# Altium schematic sheet HDMI2.0_SHEET.SchDoc
size A4; SheetNumber: 21; SheetTotal: 23
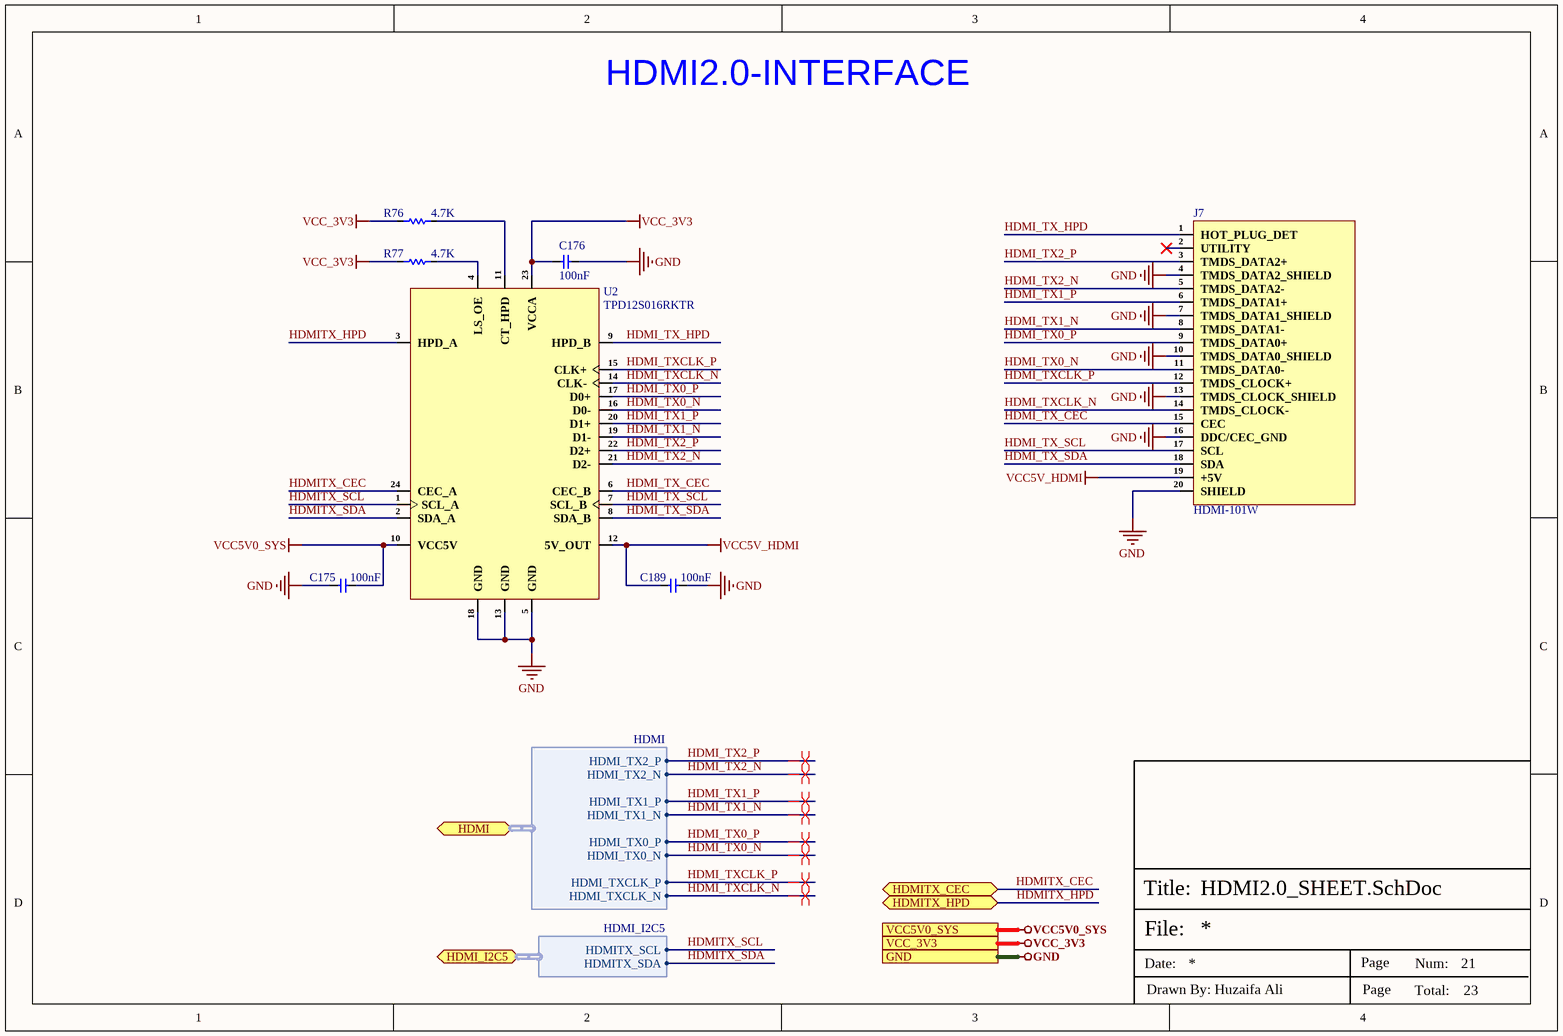
[diagram p0: HDMI2.0_SHEET.SchDoc]

## Parts
C175  100nF  [Cap-0402]
C176  100nF  [Cap-0402]
C189  100nF  [Cap-0402]
J7  HDMI-101W  [HDMI-101W]
R76  4.7K  [Res-0402]
R77  4.7K  [Res-0402]
U2  TPD12S016RKTR  [24-UQFN (4x2)]

## Ports
GND (see DRAM_LPDDR4_SHEET[6D], eMMC_SPI-FLASH_SHEET[1D], POWER_LDO_SHEET[3D], POWER_OTHER_SHEET[3C], POWER_PMIC_RK809_CODEC[3C], POWER_PMIC_RK809_DC DC[3D], POWER_PMIC_RK809_LDO[4C], POWER_PMIC_RK809_MGM[3D], RK3566_AUDIO_SHEET[3C], RK3566_DDR-PHY_SHEET[5D], RK3566_FLASH-SD_SHEET[4C], RK3566_OSC_PMUIO_SHEET[5D], RK3566_POWER_SHEET[3D], RK3566_SARADC_GPIO[3D], RK3566_USB_PCIe_SHEET[3D], RK3566_VI_SHEET[3D], RK3566_VO_SHEET_1[3C], RK3566_VO_SHEET_2[4C], TYPE-C_INTERFACE_SHEET[3D], TYPE-C_TO_MIPI-CSI_SHEET[5D], USB2.0_SHEET[3D], WIFI-6_SHEET[3D]), HDMI (bidir, harness HDMI, see RK3566_VO_SHEET_1[2C]), HDMI_I2C5 (bidir, harness HDMI_I2C5, see RK3566_AUDIO_SHEET[3B]), HDMITX_CEC (bidir, see RK3566_AUDIO_SHEET[3C]), HDMITX_HPD (bidir, see RK3566_VO_SHEET_1[3C]), VCC5V0_SYS (see POWER_LDO_SHEET[3D], POWER_OTHER_SHEET[3C], POWER_PMIC_RK809_CODEC[3C], POWER_PMIC_RK809_MGM[3D], RK3566_USB_PCIe_SHEET[3C], TYPE-C_INTERFACE_SHEET[3D], USB2.0_SHEET[3D]), VCC_3V3 (see eMMC_SPI-FLASH_SHEET[1D], POWER_PMIC_RK809_LDO[4C], RK3566_AUDIO_SHEET[3C], RK3566_SARADC_GPIO[3D], RK3566_USB_PCIe_SHEET[3D], RK3566_VI_SHEET[3D], RK3566_VO_SHEET_2[4C], TYPE-C_TO_MIPI-CSI_SHEET[5D], WIFI-6_SHEET[3D])

## Harnesses
HDMI_I2C5: HDMITX_SCL, HDMITX_SDA
HDMI: HDMI_TX2_P, HDMI_TX2_N, HDMI_TX1_P, HDMI_TX1_N, HDMI_TX0_P, HDMI_TX0_N, HDMI_TXCLK_P, HDMI_TXCLK_N

## Nets
GND: C175.2 C176.1 C189.2 J7.4(TMDS_DATA2_SHIELD) J7.7(TMDS_DATA1_SHIELD) J7.10(TMDS_DATA0_SHIELD) J7.13(TMDS_CLOCK_SHIELD) J7.16(DDC/CEC_GND) J7.20(SHIELD) U2.5(GND) U2.13(GND) U2.18(GND) ; port GND
VCC5V0_SYS: C175.1 U2.10(VCC5V) ; port VCC5V0_SYS
VCC5V_HDMI: C189.1 J7.19(+5V) U2.12(5V_OUT)
VCC_3V3: C176.2 R76.2 R77.2 U2.23(VCCA) ; port VCC_3V3
HDMI_TX0_N: J7.11(TMDS_DATA0-) U2.16(D0-) ; port HDMI.HDMI_TX0_N
HDMI_TX0_P: J7.9(TMDS_DATA0+) U2.17(D0+) ; port HDMI.HDMI_TX0_P
HDMI_TX1_N: J7.8(TMDS_DATA1-) U2.19(D1-) ; port HDMI.HDMI_TX1_N
HDMI_TX1_P: J7.6(TMDS_DATA1+) U2.20(D1+) ; port HDMI.HDMI_TX1_P
HDMI_TX2_N: J7.5(TMDS_DATA2-) U2.21(D2-) ; port HDMI.HDMI_TX2_N
HDMI_TX2_P: J7.3(TMDS_DATA2+) U2.22(D2+) ; port HDMI.HDMI_TX2_P
HDMI_TX_CEC: J7.15(CEC) U2.6(CEC_B)
HDMI_TX_HPD: J7.1(HOT_PLUG_DET) U2.9(HPD_B)
HDMI_TX_SCL: J7.17(SCL) U2.7(SCL_B)
HDMI_TX_SDA: J7.18(SDA) U2.8(SDA_B)
HDMI_TXCLK_N: J7.14(TMDS_CLOCK-) U2.14(CLK-) ; port HDMI.HDMI_TXCLK_N
HDMI_TXCLK_P: J7.12(TMDS_CLOCK+) U2.15(CLK+) ; port HDMI.HDMI_TXCLK_P
HDMITX_CEC: U2.24(CEC_A) ; port HDMITX_CEC
HDMITX_HPD: U2.3(HPD_A) ; port HDMITX_HPD
HDMITX_SCL: U2.1(SCL_A) ; port HDMI_I2C5.HDMITX_SCL
HDMITX_SDA: U2.2(SDA_A) ; port HDMI_I2C5.HDMITX_SDA
NetR76_1: R76.1 U2.11(CT_HPD)
NetR77_1: R77.1 U2.4(LS_OE)

Not connected (* = marked no-connect by the designer): J7 2(UTILITY)*

## Layout directives
differential pair; differential pair class HDMI_100R: HDMI_TX0_N, HDMI_TX0_P, HDMI_TX1_N, HDMI_TX1_P, HDMI_TX2_N, HDMI_TX2_P, HDMI_TXCLK_N, HDMI_TXCLK_P

## Notes on the sheet
- HDMI2.0-INTERFACE
- File:
- Title:
- Date:
- Page
- Num:
- Total:
- Drawn By: Huzaifa Ali

## Library data of the parts
C175 C176 C189 = CC0402KRX5R7BB104: CAP CER 0.1UF 16V X5R 0402; Manufacturer: Yageo; Tolerance: 10%; Manufacturer Part Number: CC0402KRX5R7BB104; RoHS: Yes; Category: Ceramic Capacitors; Supplier 1: Mouser; Stock 1: 936792; Pricing 1: 1=0.10000, 10=0.02300, 50=0.02300, 100=0.01100, 1000=0.00600, 10000=0.00400 (USD); Mount: Surface Mount; Case/Package: 0402; Number of Pins: 2; Case Code (Metric): 1005; Case Code (Imperial): 0402; Min Operating Temperature: -55°C; Max Operating Temperature: 85°C; Capacitance: 100nF; Dielectric: X5R; Packaging: Tape and Reel; Voltage Rating: 16V; Package Quantity: 1; Voltage Rating (DC): 16V; Termination: SMD/SMT; Resistor Type: Ceramic; Series: CC; Construction: Flat; Length: 1mm; Width: 0.02inch; Height: 0.5mm; Thickness: 0.022inch; Depth: 0.5mm; Radiation Hardening: No; REACH SVHC: Unknown; Lead Free: Lead Free; Halogen Free: Halogen Free; RoHS Compliant: Yes; ComponentLink1URL: https://datasheet.ciiva.com/155/mlccorderingcode-155879.pdf?src-supplier=Digi-Key; ComponentLink1Description: https://datasheet.ciiva.com/155/mlccorderingcode-155879.pdf?src-supplier=Digi-Key; ComponentLink2URL: https://datasheet.ciiva.com/155/mlccorderingcode-155878.pdf?src-supplier=Digi-Key; ComponentLink2Description: https://datasheet.ciiva.com/155/mlccorderingcode-155878.pdf?src-supplier=Digi-Key; ComponentLink3URL: https://datasheet.ciiva.com/155/mlccorderingcode-155880.pdf?src-supplier=Digi-Key; ComponentLink3Description: https://datasheet.ciiva.com/155/mlccorderingcode-155880.pdf?src-supplier=Digi-Key; ComponentLink4URL: https://datasheet.ciiva.com/11464/upy-gphc-x5r-4v-to-50v-12-11464869.pdf?src-supplier=Avnet; ComponentLink4Description: https://datasheet.ciiva.com/11464/upy-gphc-x5r-4v-to-50v-12-11464869.pdf?src-supplier=Avnet; Supplier Part Number 1: 603-CC402KRX5R7BB104; LCSC Part Number: C106204
J7 = HDMI-101W: SMD HDMI Connectors ROHS; Manufacturer: XUNPU; Manufacturer Part Number: HDMI-101W; Package: SMD; LCSC Part Number: C720619; Item Type: Connector; ComponentLink1Description: LCSC; ComponentLink1URL: https://www.lcsc.com/product-detail/HDMI-Connectors_XUNPU-HDMI-101W_C720619.html
R76 R77 = RC0402FR-074K7L: RES 4.7K OHM 1% 1/16W 0402; Manufacturer: Yageo; Max Power Dissipation: 63mW; Temperature Coefficient: 100ppm/°C; Resistance: 4.7kR; Voltage Rating (DC): 50V; Power Rating: 62.5mW; Item Type: Resistor; Manufacturer Part Number: RC0402FR-074K7L; RoHS: Yes; Category: Chip SMD Resistors; Case/Package: 0402; Case Code (Imperial): 0402; Case Code (Metric): 1005; Min Operating Temperature: -55°C; Max Operating Temperature: 155°C; Features: Moisture Resistant; Packaging: Tape and Reel; Tolerance: 1%; Number of Terminations: 2; Series: RC; RoHS Compliant: Yes; ComponentLink1URL: https://datasheet.ciiva.com/22661/1686128-22661342.pdf?src-supplier=Element14; ComponentLink1Description: https://datasheet.ciiva.com/22661/1686128-22661342.pdf?src-supplier=Element14; Supplier 1: Avnet; Stock 1: 2420000; Pricing 1: 10000=0.00085 (USD); Number of Pins: 2; Resistor Type: Thick Film; Voltage Rating: 50V; Termination: SMD/SMT; Resistance Tolerance: 1%; Construction: Rectangular; Length: 1mm; Width: 0.5mm; Height: 0.32mm; Depth: 0.5mm; Lead Free: Lead Free; Military Standard: Not; ComponentLink2URL: https://datasheet.ciiva.com/7850/1018594-7850022.pdf?src-supplier=Element14; ComponentLink2Description: https://datasheet.ciiva.com/7850/1018594-7850022.pdf?src-supplier=Element14; ComponentLink3URL: https://datasheet.ciiva.com/7850/1018594-7850023.pdf?src-supplier=Element14; ComponentLink3Description: https://datasheet.ciiva.com/7850/1018594-7850023.pdf?src-supplier=Element14; ComponentLink4URL: https://datasheet.ciiva.com/15215/getdatasheetpartid-328119-15215035.pdf?src-supplier=Verical; ComponentLink4Description: https://datasheet.ciiva.com/15215/getdatasheetpartid-328119-15215035.pdf?src-supplier=Verical; Supplier Part Number 1: RC0402FR-074K7L; LCSC Part Number: C105871; Size Code: 0402; Height - Seated (Max): 0.016inch; Reach SVHC Compliant: Yes
U2 = TPD12S016RKTR: IC INTERFACE SPECIALIZED 24UQFN; Manufacturer: Texas Instruments; Supplier: Mouser; Supplier Part Number: 595-TPD12S016RKTR; Manufacturer Part Number: TPD12S016RKTR; RoHS: Yes; Category: Interface ICs; Stock: 5223; Pricing: 1=0.82, 10=0.694, 50=0.694, 100=0.537, 1000=0.443, 10000=0.442 (USD); ComponentLink1URL: https://datasheet.ciiva.com/12545/tpd12s016-108314-12545332.pdf?src-supplier=Mouser; ComponentLink1Description: https://datasheet.ciiva.com/12545/tpd12s016-108314-12545332.pdf?src-supplier=Mouser; ComponentLink2URL: https://datasheet.ciiva.com/14195/tpd12s016-14195158.pdf?src-supplier=Avnet; ComponentLink2Description: https://datasheet.ciiva.com/14195/tpd12s016-14195158.pdf?src-supplier=Avnet; ComponentLink3URL: https://datasheet.ciiva.com/6632/tpd12s016-6632086.pdf?src-supplier=Digikey; ComponentLink3Description: https://datasheet.ciiva.com/6632/tpd12s016-6632086.pdf?src-supplier=Digikey